# Altium schematic sheet USB_Connector.SchDoc
size A4; SheetNumber: 5; SheetTotal: 5
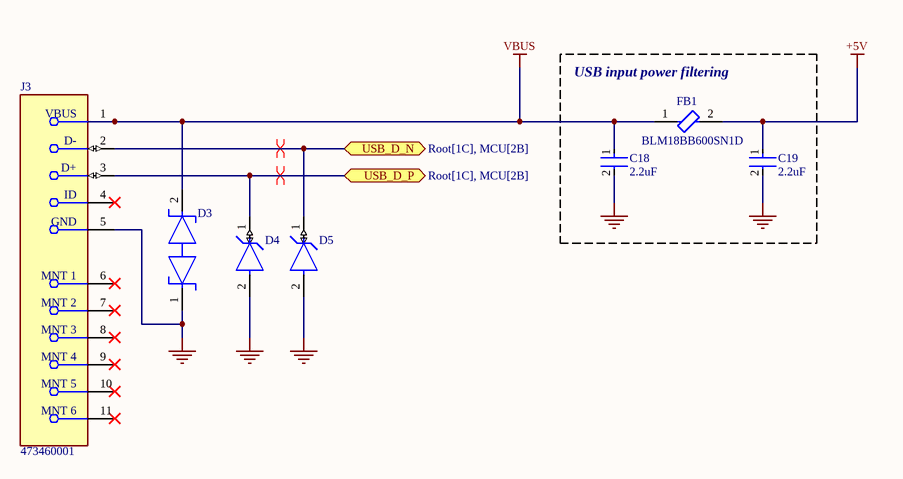
[diagram p0: USB_Connector.SchDoc]

## Parts
C18  2.2uF  [FP-CC0603-DA-MFG]
C19  2.2uF  [FP-CC0603-DA-MFG]
D3  TPD1E10B06DPYR  [FP-DPY0002A-MFG]  (value not drawn)
D4  ESD321DPYR  [FP-DPY0002A-MFG]  (value not drawn)
D5  ESD321DPYR  [FP-DPY0002A-MFG]  (value not drawn)
FB1  BLM18BB600SN1D  [FP-BLM18-0_15-t0_8-IPC_B]
J3  473460001  [FP-473460001-MFG]

## Blocks framed on the sheet
USB input power filtering: C18 C19 FB1

## Ports
USB_D_N (bidir, see Root[1C], MCU[2B]), USB_D_P (bidir, see Root[1C], MCU[2B])

## Nets
+5V: C19.1 FB1.2
GND: C18.2 C19.2 D3.1 D4.2(GND) D5.2(GND) J3.5(GND)
VBUS: C18.1 D3.2 FB1.1 J3.1(VBUS)
USB_D_N: D5.1(IO) J3.2(D-) ; port USB_D_N
USB_D_P: D4.1(IO) J3.3(D+) ; port USB_D_P

Not connected (* = marked no-connect by the designer): J3 4(ID)* 6(MNT_1)* 7(MNT_2)* 8(MNT_3)* 9(MNT_4)* 10(MNT_5)* 11(MNT_6)*

## Layout directives
differential pair; differential pair class DIFF_USB: USB_D_N, USB_D_P

## Library data of the parts
C18 C19 = CMP-03422-000148-1: CAP CER 2.2UF 10V X7R 0603; Manufacturer: YAGEO; Manufacturer Part Number: CC0603KRX7R6BB225; Tolerance: 0.1; Temperature Coefficient: 15%; Material: Ceramic; Category: Cap; Temperature Range Low: -55°C; Device Class L1: Passive Components; ComponentLink2URL: http://www.yageo.com/documents/recent/UPY-GPHC_X7R_6.3V-to-50V_18.pdf; Value: 2.2 uF; Octopart: https://octopart.com/cc0603krx7r6bb225-yageo-20649696; Lead Free: Yes; Digikey Description: CAP CER 2.2UF 10V X7R 0603; Device Class L2: Capacitors; Height: 0.9mm; Package: CC0603-DA; Automotive: No; Voltage Rating: 10 V; Temperature Characteristic: X7R; Mouser Description: Multilayer Ceramic Capacitors MLCC - SMD/SMT 2.2uF 10V X7R 10%; Device Class L3: Ceramic Capacitors; Temperature Range High: +125°C; RoHS: TRUE; Temperature: -55°C to +125°C; Footprint Url: http://www.yageo.com/exep/pages/download/literatures/UPY-C_GEN_24.pdf; ComponentLink2Description: Datasheet; Voltage: 10 V; Capacitance: 2.2 uF
D3 = CMP-0326-00004-4: TVS DIODE 5.5V 14V 2X1SON; Leakage Current: 100nA; Min Breakdown Voltage: 6V; Number of Channels: 1; ESD Protection: Yes; Power Line Protection: No; Test Current: 1mA; Interface: GPIO; Element Configuration: Single; Peak Pulse Current: 5A; Direction: Bidirectional; Peak Pulse Power: 90W; Capacitance: 12pF; Composition: Zener; Packaging: Tape and Reel; Number of Pins: 2; Breakdown Voltage: 6V; Radiation Hardening: No; Min Operating Temperature: -40°C; Contact Plating: Gold; Lead Free: Lead Free; Height: 0.35mm; REACH SVHC: No SVHC; Case/Package: 0402; Max Operating Temperature: 125°C; Width: 0.7mm; Clamping Voltage: 14V; Package Quantity: 1; Max Reverse Leakage Current: 100nA; Working Voltage: 5.5V; Length: 1.1mm; Number of Bidirectional Channels: 1; Reverse Standoff Voltage: 5.5V
D4 D5 = CMP-04989-000001-1: HDMI2.0 ESD PROTECTION; Manufacturer: Texas Instruments; Standoff Height: 0mm; Peak Pulse Current: 6A; Value: 0.9pF; Number Of Channels: 1; Reverse Standoff Voltage: 3.6V; Peak Pulse Power: 40W; Breakdown Voltage: 4.5V; Direction: Unidirectional; Clamping Voltage: 6.8V; RoHS: TRUE; Temperature: -40°C to +125°C; Package: DPY0002A; Temperature Range Low: -40°C; Temperature Range High: +125°C; Category: Diode; Capacitance: 0.9pF; Ambient Temperature Range Low: -40°C; Device Class L3: unset; Device Class L1: Circuit Protection; Ambient Temperature Range High: +125°C; ComponentLink2URL: http://www.ti.com/lit/ds/symlink/esd321.pdf; Octopart: https://octopart.com/esd321dpyr-texas+instruments-94354200; Manufacturer Part Number: ESD321DPYR; Digikey Description: HDMI2.0 ESD PROTECTION; Lead Free: Yes; ComponentLink2Description: Datasheet; Device Class L2: TVS Diodes; Height: 0.45mm; Automotive: No
FB1 = CMP-0686-00415-3: Chip Ferrite Bead, 0603, 60Ω @ 100MHz, 0.25Ω, 25%, 600mA; Impedance: 60R; Current Rating: 550mA; Number of Circuits: 1; Shielding: Unshielded; Resistance: 350mR; Material: Steel; DC Resistance (DCR): 250mR; REACH SVHC: No SVHC; Height: 0.8mm; Packaging: Tape and Reel; Military Standard: Not; Case/Package: 0603; Lead Free: Lead Free; Termination: SMD/SMT; Length: 1.6mm; Case Code (Imperial): 0603; Package Quantity: 1; RoHS Compliant: Yes; DC Current: 550mA; Core Material: Ferrite; Max DC Current: 550mA; Radiation Hardening: No; Number of Pins: 2; Width: 0.8mm; Series: BLM18B; Depth: 0.8mm; Tolerance: 25%; Number of Lines: 1; Case Code (Metric): 1608; Max Current Rating: 550mA; Test Frequency: 100MHz; Min Operating Temperature: -55°C; Max Operating Temperature: 125°C
J3 = CMP-2000-05246-2: CONN RCPT USB2.0 MICRO B SMD R/A; Manufacturer: Molex; Conn Orientation: Right Angle; Is Female: yes; Shielding: true; Pitch: 0.65mm; Number Of Contacts: 5; Voltage Rating: 30V; Current Rating: 1.8A; Device Class L2: USB Connectors; Digikey Description: CONN RCPT USB2.0 MICRO B SMD R/A; Height: 2.945mm; RoHS: TRUE; ComponentLink2Description: Datasheet; Octopart: https://octopart.com/47346-0001-molex-7164928; Automotive: No; Package: 0; Category: Conn; Device Class L1: Connectors; Usb Standard: USB 2.0; Temperature: -30°C to +85°C; Temperature Range Low: -30°C; Footprint Url: https://www.molex.com/pdm_docs/sd/473460001_sd.pdf; ComponentLink2URL: https://www.molex.com/webdocs/datasheets/pdf/en-us/0473460001_IO_CONNECTORS.pdf; Lead Free: Yes; Manufacturer Part Number: 473460001; Contact Material: Gold,Nickel; Temperature Range High: +85°C; Device Class L3: unset